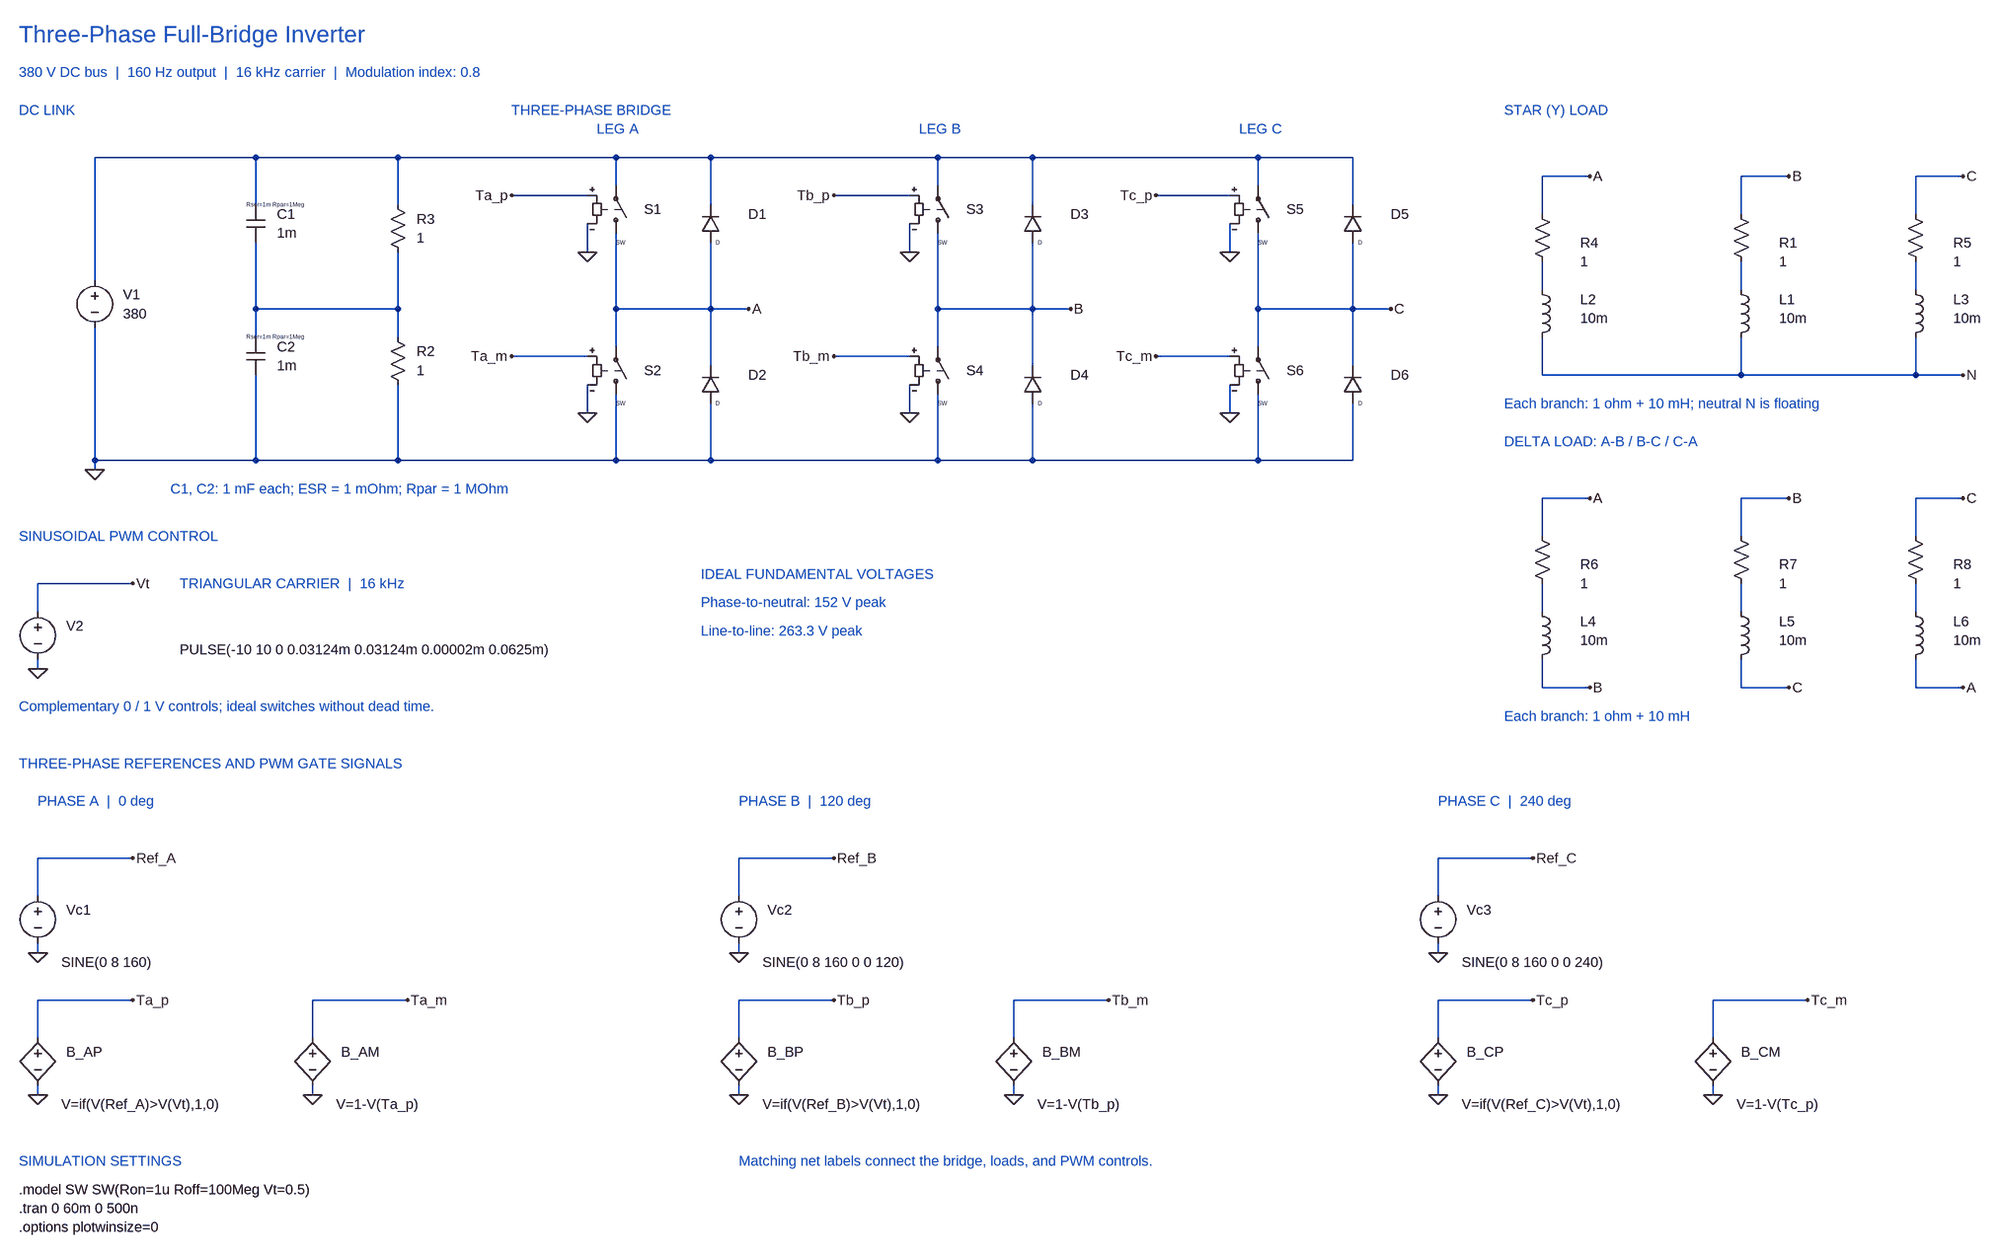
[diagram p0: schematic Three_Phase_Full_Bridge_Inverter_Simulation.asc]
Three_Phase_Full_Bridge_Inverter_Simulation.asc, the LTspice schematic file:
Version 4
SHEET 1 3712 2144
WIRE 256 256 528 256
WIRE 528 256 768 256
WIRE 256 464 256 256
WIRE 256 544 256 768
WIRE 528 336 528 256
WIRE 528 400 528 512
WIRE 528 512 528 560
WIRE 528 624 528 768
WIRE 768 336 768 256
WIRE 768 416 768 512
WIRE 768 512 768 560
WIRE 768 640 768 768
WIRE 528 512 768 512
WIRE 256 768 528 768
WIRE 528 768 768 768
WIRE 256 768 256 784
WIRE 768 256 1136 256
WIRE 1136 256 1296 256
WIRE 768 768 1136 768
WIRE 1136 768 1296 768
WIRE 1136 256 1136 304
WIRE 1136 384 1136 512
WIRE 1136 512 1136 576
WIRE 1136 656 1136 768
WIRE 1296 336 1296 256
WIRE 1296 400 1296 512
WIRE 1296 512 1296 608
WIRE 1296 672 1296 768
WIRE 1136 512 1296 512
WIRE 1296 512 1360 512
WIRE 960 320 1088 320
WIRE 1088 368 1088 416
WIRE 960 592 1088 592
WIRE 1088 640 1088 688
WIRE 1296 256 1680 256
WIRE 1680 256 1840 256
WIRE 1296 768 1680 768
WIRE 1680 768 1840 768
WIRE 1680 256 1680 304
WIRE 1680 384 1680 512
WIRE 1680 512 1680 576
WIRE 1680 656 1680 768
WIRE 1840 336 1840 256
WIRE 1840 400 1840 512
WIRE 1840 512 1840 608
WIRE 1840 672 1840 768
WIRE 1680 512 1840 512
WIRE 1840 512 1904 512
WIRE 1504 320 1632 320
WIRE 1632 368 1632 416
WIRE 1504 592 1632 592
WIRE 1632 640 1632 688
WIRE 1840 256 2224 256
WIRE 2224 256 2384 256
WIRE 1840 768 2224 768
WIRE 2224 768 2384 768
WIRE 2224 256 2224 304
WIRE 2224 384 2224 512
WIRE 2224 512 2224 576
WIRE 2224 656 2224 768
WIRE 2384 336 2384 256
WIRE 2384 400 2384 512
WIRE 2384 512 2384 608
WIRE 2384 672 2384 768
WIRE 2224 512 2384 512
WIRE 2384 512 2448 512
WIRE 2048 320 2176 320
WIRE 2176 368 2176 416
WIRE 2048 592 2176 592
WIRE 2176 640 2176 688
WIRE 2704 288 2784 288
WIRE 2704 288 2704 352
WIRE 2704 432 2704 480
WIRE 2704 560 2704 624
WIRE 3040 288 3120 288
WIRE 3040 288 3040 352
WIRE 3040 432 3040 480
WIRE 3040 560 3040 624
WIRE 3376 288 3456 288
WIRE 3376 288 3376 352
WIRE 3376 432 3376 480
WIRE 3376 560 3376 624
WIRE 2704 624 3040 624
WIRE 3040 624 3376 624
WIRE 3376 624 3456 624
WIRE 2704 832 2784 832
WIRE 2704 832 2704 896
WIRE 2704 976 2704 1024
WIRE 2704 1104 2704 1152
WIRE 2704 1152 2784 1152
WIRE 3040 832 3120 832
WIRE 3040 832 3040 896
WIRE 3040 976 3040 1024
WIRE 3040 1104 3040 1152
WIRE 3040 1152 3120 1152
WIRE 3376 832 3456 832
WIRE 3376 832 3376 896
WIRE 3376 976 3376 1024
WIRE 3376 1104 3376 1152
WIRE 3376 1152 3456 1152
WIRE 160 1024 160 976
WIRE 160 976 320 976
WIRE 160 1104 160 1120
WIRE 160 1504 160 1440
WIRE 160 1440 320 1440
WIRE 160 1584 160 1600
WIRE 160 1744 160 1680
WIRE 160 1680 320 1680
WIRE 160 1824 160 1840
WIRE 624 1744 624 1680
WIRE 624 1680 784 1680
WIRE 624 1824 624 1840
WIRE 1344 1504 1344 1440
WIRE 1344 1440 1504 1440
WIRE 1344 1584 1344 1600
WIRE 1344 1744 1344 1680
WIRE 1344 1680 1504 1680
WIRE 1344 1824 1344 1840
WIRE 1808 1744 1808 1680
WIRE 1808 1680 1968 1680
WIRE 1808 1824 1808 1840
WIRE 2528 1504 2528 1440
WIRE 2528 1440 2688 1440
WIRE 2528 1584 2528 1600
WIRE 2528 1744 2528 1680
WIRE 2528 1680 2688 1680
WIRE 2528 1824 2528 1840
WIRE 2992 1744 2992 1680
WIRE 2992 1680 3152 1680
WIRE 2992 1824 2992 1840
FLAG 256 784 0
FLAG 1360 512 A
FLAG 960 320 Ta_p
FLAG 1088 416 0
FLAG 960 592 Ta_m
FLAG 1088 688 0
FLAG 1904 512 B
FLAG 1504 320 Tb_p
FLAG 1632 416 0
FLAG 1504 592 Tb_m
FLAG 1632 688 0
FLAG 2448 512 C
FLAG 2048 320 Tc_p
FLAG 2176 416 0
FLAG 2048 592 Tc_m
FLAG 2176 688 0
FLAG 2784 288 A
FLAG 3120 288 B
FLAG 3456 288 C
FLAG 3456 624 N
FLAG 2784 832 A
FLAG 2784 1152 B
FLAG 3120 832 B
FLAG 3120 1152 C
FLAG 3456 832 C
FLAG 3456 1152 A
FLAG 320 976 Vt
FLAG 160 1120 0
FLAG 320 1440 Ref_A
FLAG 160 1600 0
FLAG 320 1680 Ta_p
FLAG 160 1840 0
FLAG 784 1680 Ta_m
FLAG 624 1840 0
FLAG 1504 1440 Ref_B
FLAG 1344 1600 0
FLAG 1504 1680 Tb_p
FLAG 1344 1840 0
FLAG 1968 1680 Tb_m
FLAG 1808 1840 0
FLAG 2688 1440 Ref_C
FLAG 2528 1600 0
FLAG 2688 1680 Tc_p
FLAG 2528 1840 0
FLAG 3152 1680 Tc_m
FLAG 2992 1840 0
SYMBOL voltage 256 448 R0
WINDOW 0 48 40 Left 2
WINDOW 3 48 72 Left 2
WINDOW 123 0 0 Left 0
WINDOW 39 0 0 Left 0
SYMATTR InstName V1
SYMATTR Value 380
SYMBOL cap 512 336 R0
WINDOW 0 52 16 Left 2
WINDOW 3 52 48 Left 2
WINDOW 39 0 0 Left 0
SYMATTR InstName C1
SYMATTR Value 1m
SYMATTR SpiceLine Rser=1m Rpar=1Meg
SYMBOL cap 512 560 R0
WINDOW 0 52 16 Left 2
WINDOW 3 52 48 Left 2
WINDOW 39 0 0 Left 0
SYMATTR InstName C2
SYMATTR Value 1m
SYMATTR SpiceLine Rser=1m Rpar=1Meg
SYMBOL res 3056 448 R180
WINDOW 0 -48 48 Right 2
WINDOW 3 -48 16 Right 2
SYMATTR InstName R1
SYMATTR Value 1
SYMBOL ind 3024 464 R0
WINDOW 0 80 32 Left 2
WINDOW 3 80 64 Left 2
SYMATTR InstName L1
SYMATTR Value 10m
SYMBOL sw 1136 400 M180
WINDOW 0 48 56 Left 2
WINDOW 3 0 0 Left 0
SYMATTR InstName S1
SYMBOL diode 1312 400 R180
WINDOW 0 -48 48 Right 2
WINDOW 3 0 0 Left 0
SYMATTR InstName D1
SYMBOL sw 1136 672 M180
WINDOW 0 48 56 Left 2
WINDOW 3 0 0 Left 0
SYMATTR InstName S2
SYMBOL diode 1312 672 R180
WINDOW 0 -48 48 Right 2
WINDOW 3 0 0 Left 0
SYMATTR InstName D2
SYMBOL voltage 160 1488 R0
WINDOW 0 48 40 Left 2
WINDOW 3 40 128 Left 2
WINDOW 123 0 0 Left 0
WINDOW 39 0 0 Left 0
SYMATTR InstName Vc1
SYMATTR Value SINE(0 8 160)
SYMBOL voltage 160 1008 R0
WINDOW 0 48 40 Left 2
WINDOW 3 240 80 Left 2
WINDOW 123 0 0 Left 0
WINDOW 39 0 0 Left 0
SYMATTR Value PULSE(-10 10 0 0.03124m 0.03124m 0.00002m 0.0625m)
SYMATTR InstName V2
SYMBOL res 752 544 R0
WINDOW 0 48 40 Left 2
WINDOW 3 48 72 Left 2
SYMATTR InstName R2
SYMATTR Value 1
SYMBOL res 752 320 R0
WINDOW 0 48 40 Left 2
WINDOW 3 48 72 Left 2
SYMATTR InstName R3
SYMATTR Value 1
SYMBOL sw 1680 400 M180
WINDOW 0 48 56 Left 2
WINDOW 3 0 0 Left 0
SYMATTR InstName S3
SYMBOL diode 1856 400 R180
WINDOW 0 -48 48 Right 2
WINDOW 3 0 0 Left 0
SYMATTR InstName D3
SYMBOL sw 1680 672 M180
WINDOW 0 48 56 Left 2
WINDOW 3 0 0 Left 0
SYMATTR InstName S4
SYMBOL diode 1856 672 R180
WINDOW 0 -48 48 Right 2
WINDOW 3 0 0 Left 0
SYMATTR InstName D4
SYMBOL sw 2224 400 M180
WINDOW 0 48 56 Left 2
WINDOW 3 0 0 Left 0
SYMATTR InstName S5
SYMBOL diode 2400 400 R180
WINDOW 0 -48 48 Right 2
WINDOW 3 0 0 Left 0
SYMATTR InstName D5
SYMBOL sw 2224 672 M180
WINDOW 0 48 56 Left 2
WINDOW 3 0 0 Left 0
SYMATTR InstName S6
SYMBOL diode 2400 672 R180
WINDOW 0 -48 48 Right 2
WINDOW 3 0 0 Left 0
SYMATTR InstName D6
SYMBOL voltage 1344 1488 R0
WINDOW 0 48 40 Left 2
WINDOW 3 40 128 Left 2
WINDOW 123 0 0 Left 0
WINDOW 39 0 0 Left 0
SYMATTR InstName Vc2
SYMATTR Value SINE(0 8 160 0 0 120)
SYMBOL voltage 2528 1488 R0
WINDOW 0 48 40 Left 2
WINDOW 3 40 128 Left 2
WINDOW 123 0 0 Left 0
WINDOW 39 0 0 Left 0
SYMATTR InstName Vc3
SYMATTR Value SINE(0 8 160 0 0 240)
SYMBOL res 2720 448 R180
WINDOW 0 -48 48 Right 2
WINDOW 3 -48 16 Right 2
SYMATTR InstName R4
SYMATTR Value 1
SYMBOL ind 2688 464 R0
WINDOW 0 80 32 Left 2
WINDOW 3 80 64 Left 2
SYMATTR InstName L2
SYMATTR Value 10m
SYMBOL res 3392 448 R180
WINDOW 0 -48 48 Right 2
WINDOW 3 -48 16 Right 2
SYMATTR InstName R5
SYMATTR Value 1
SYMBOL ind 3360 464 R0
WINDOW 0 80 32 Left 2
WINDOW 3 80 64 Left 2
SYMATTR InstName L3
SYMATTR Value 10m
SYMBOL res 2720 992 R180
WINDOW 0 -48 48 Right 2
WINDOW 3 -48 16 Right 2
SYMATTR InstName R6
SYMATTR Value 1
SYMBOL ind 2688 1008 R0
WINDOW 0 80 32 Left 2
WINDOW 3 80 64 Left 2
SYMATTR InstName L4
SYMATTR Value 10m
SYMBOL res 3056 992 R180
WINDOW 0 -48 48 Right 2
WINDOW 3 -48 16 Right 2
SYMATTR InstName R7
SYMATTR Value 1
SYMBOL ind 3024 1008 R0
WINDOW 0 80 32 Left 2
WINDOW 3 80 64 Left 2
SYMATTR InstName L5
SYMATTR Value 10m
SYMBOL res 3392 992 R180
WINDOW 0 -48 48 Right 2
WINDOW 3 -48 16 Right 2
SYMATTR InstName R8
SYMATTR Value 1
SYMBOL ind 3360 1008 R0
WINDOW 0 80 32 Left 2
WINDOW 3 80 64 Left 2
SYMATTR InstName L6
SYMATTR Value 10m
SYMBOL bv 160 1728 R0
WINDOW 0 48 40 Left 2
WINDOW 3 40 128 Left 2
SYMATTR InstName B_AP
SYMATTR Value V=if(V(Ref_A)>V(Vt),1,0)
SYMBOL bv 624 1728 R0
WINDOW 0 48 40 Left 2
WINDOW 3 40 128 Left 2
SYMATTR InstName B_AM
SYMATTR Value V=1-V(Ta_p)
SYMBOL bv 1344 1728 R0
WINDOW 0 48 40 Left 2
WINDOW 3 40 128 Left 2
SYMATTR InstName B_BP
SYMATTR Value V=if(V(Ref_B)>V(Vt),1,0)
SYMBOL bv 1808 1728 R0
WINDOW 0 48 40 Left 2
WINDOW 3 40 128 Left 2
SYMATTR InstName B_BM
SYMATTR Value V=1-V(Tb_p)
SYMBOL bv 2528 1728 R0
WINDOW 0 48 40 Left 2
WINDOW 3 40 128 Left 2
SYMATTR InstName B_CP
SYMATTR Value V=if(V(Ref_C)>V(Vt),1,0)
SYMBOL bv 2992 1728 R0
WINDOW 0 48 40 Left 2
WINDOW 3 40 128 Left 2
SYMATTR InstName B_CM
SYMATTR Value V=1-V(Tc_p)
TEXT 1104 208 Left 2 ;LEG A
TEXT 1648 208 Left 2 ;LEG B
TEXT 2192 208 Left 2 ;LEG C
TEXT 160 1344 Left 2 ;PHASE A  |  0 deg
TEXT 1344 1344 Left 2 ;PHASE B  |  120 deg
TEXT 2528 1344 Left 2 ;PHASE C  |  240 deg
TEXT 128 48 Left 4 ;Three-Phase Full-Bridge Inverter
TEXT 128 112 Left 2 ;380 V DC bus  |  160 Hz output  |  16 kHz carrier  |  Modulation index: 0.8
TEXT 128 176 Left 2 ;DC LINK
TEXT 960 176 Left 2 ;THREE-PHASE BRIDGE
TEXT 2640 176 Left 2 ;STAR (Y) LOAD
TEXT 384 816 Left 2 ;C1, C2: 1 mF each; ESR = 1 mOhm; Rpar = 1 MOhm
TEXT 2640 672 Left 2 ;Each branch: 1 ohm + 10 mH; neutral N is floating
TEXT 2640 736 Left 2 ;DELTA LOAD: A-B / B-C / C-A
TEXT 2640 1200 Left 2 ;Each branch: 1 ohm + 10 mH
TEXT 128 896 Left 2 ;SINUSOIDAL PWM CONTROL
TEXT 400 976 Left 2 ;TRIANGULAR CARRIER  |  16 kHz
TEXT 128 1184 Left 2 ;Complementary 0 / 1 V controls; ideal switches without dead time.
TEXT 1280 960 Left 2 ;IDEAL FUNDAMENTAL VOLTAGES
TEXT 1280 1008 Left 2 ;Phase-to-neutral: 152 V peak
TEXT 1280 1056 Left 2 ;Line-to-line: 263.3 V peak
TEXT 128 1280 Left 2 ;THREE-PHASE REFERENCES AND PWM GATE SIGNALS
TEXT 128 1952 Left 2 ;SIMULATION SETTINGS
TEXT 1344 1952 Left 2 ;Matching net labels connect the bridge, loads, and PWM controls.
TEXT 128 2000 Left 2 !.model SW SW(Ron=1u Roff=100Meg Vt=0.5)
TEXT 128 2032 Left 2 !.tran 0 60m 0 500n
TEXT 128 2064 Left 2 !.options plotwinsize=0

The netlist it stands for:
* Three_Phase_Full_Bridge_Inverter_Simulation.asc
V1 N001 0 380
C1 N001 N002 1m Rser=1m Rpar=1Meg
C2 N002 0 1m Rser=1m Rpar=1Meg
R1 N004 B 1
L1 N004 N 10m
S1 A N001 Ta_p 0 SW
D1 A N001 D
S2 0 A Ta_m 0 SW
D2 0 A D
Vc1 Ref_A 0 SINE(0 8 160)
V2 Vt 0 PULSE(-10 10 0 0.03124m 0.03124m 0.00002m 0.0625m)
R2 N002 0 1
R3 N001 N002 1
S3 B N001 Tb_p 0 SW
D3 B N001 D
S4 0 B Tb_m 0 SW
D4 0 B D
S5 C N001 Tc_p 0 SW
D5 C N001 D
S6 0 C Tc_m 0 SW
D6 0 C D
Vc2 Ref_B 0 SINE(0 8 160 0 0 120)
Vc3 Ref_C 0 SINE(0 8 160 0 0 240)
R4 N003 A 1
L2 N003 N 10m
R5 N005 C 1
L3 N005 N 10m
R6 N006 A 1
L4 N006 B 10m
R7 N007 B 1
L5 N007 C 10m
R8 N008 C 1
L6 N008 A 10m
B_AP Ta_p 0 V=if(V(Ref_A)>V(Vt),1,0)
B_AM Ta_m 0 V=1-V(Ta_p)
B_BP Tb_p 0 V=if(V(Ref_B)>V(Vt),1,0)
B_BM Tb_m 0 V=1-V(Tb_p)
B_CP Tc_p 0 V=if(V(Ref_C)>V(Vt),1,0)
B_CM Tc_m 0 V=1-V(Tc_p)
.model D D
.lib standard.dio
* LEG A
* LEG B
* LEG C
* PHASE A  |  0 deg
* PHASE B  |  120 deg
* PHASE C  |  240 deg
* Three-Phase Full-Bridge Inverter
* 380 V DC bus  |  160 Hz output  |  16 kHz carrier  |  Modulation index: 0.8
* DC LINK
* THREE-PHASE BRIDGE
* STAR (Y) LOAD
* C1, C2: 1 mF each; ESR = 1 mOhm; Rpar = 1 MOhm
* Each branch: 1 ohm + 10 mH; neutral N is floating
* DELTA LOAD: A-B / B-C / C-A
* Each branch: 1 ohm + 10 mH
* SINUSOIDAL PWM CONTROL
* TRIANGULAR CARRIER  |  16 kHz
* Complementary 0 / 1 V controls; ideal switches without dead time.
* IDEAL FUNDAMENTAL VOLTAGES
* Phase-to-neutral: 152 V peak
* Line-to-line: 263.3 V peak
* THREE-PHASE REFERENCES AND PWM GATE SIGNALS
* SIMULATION SETTINGS
* Matching net labels connect the bridge, loads, and PWM controls.
.model SW SW(Ron=1u Roff=100Meg Vt=0.5)
.tran 0 60m 0 500n
.options plotwinsize=0
.backanno
.end